# Altium schematic sheet 06_RK3588MQ.SchDoc (part 3 of 3)
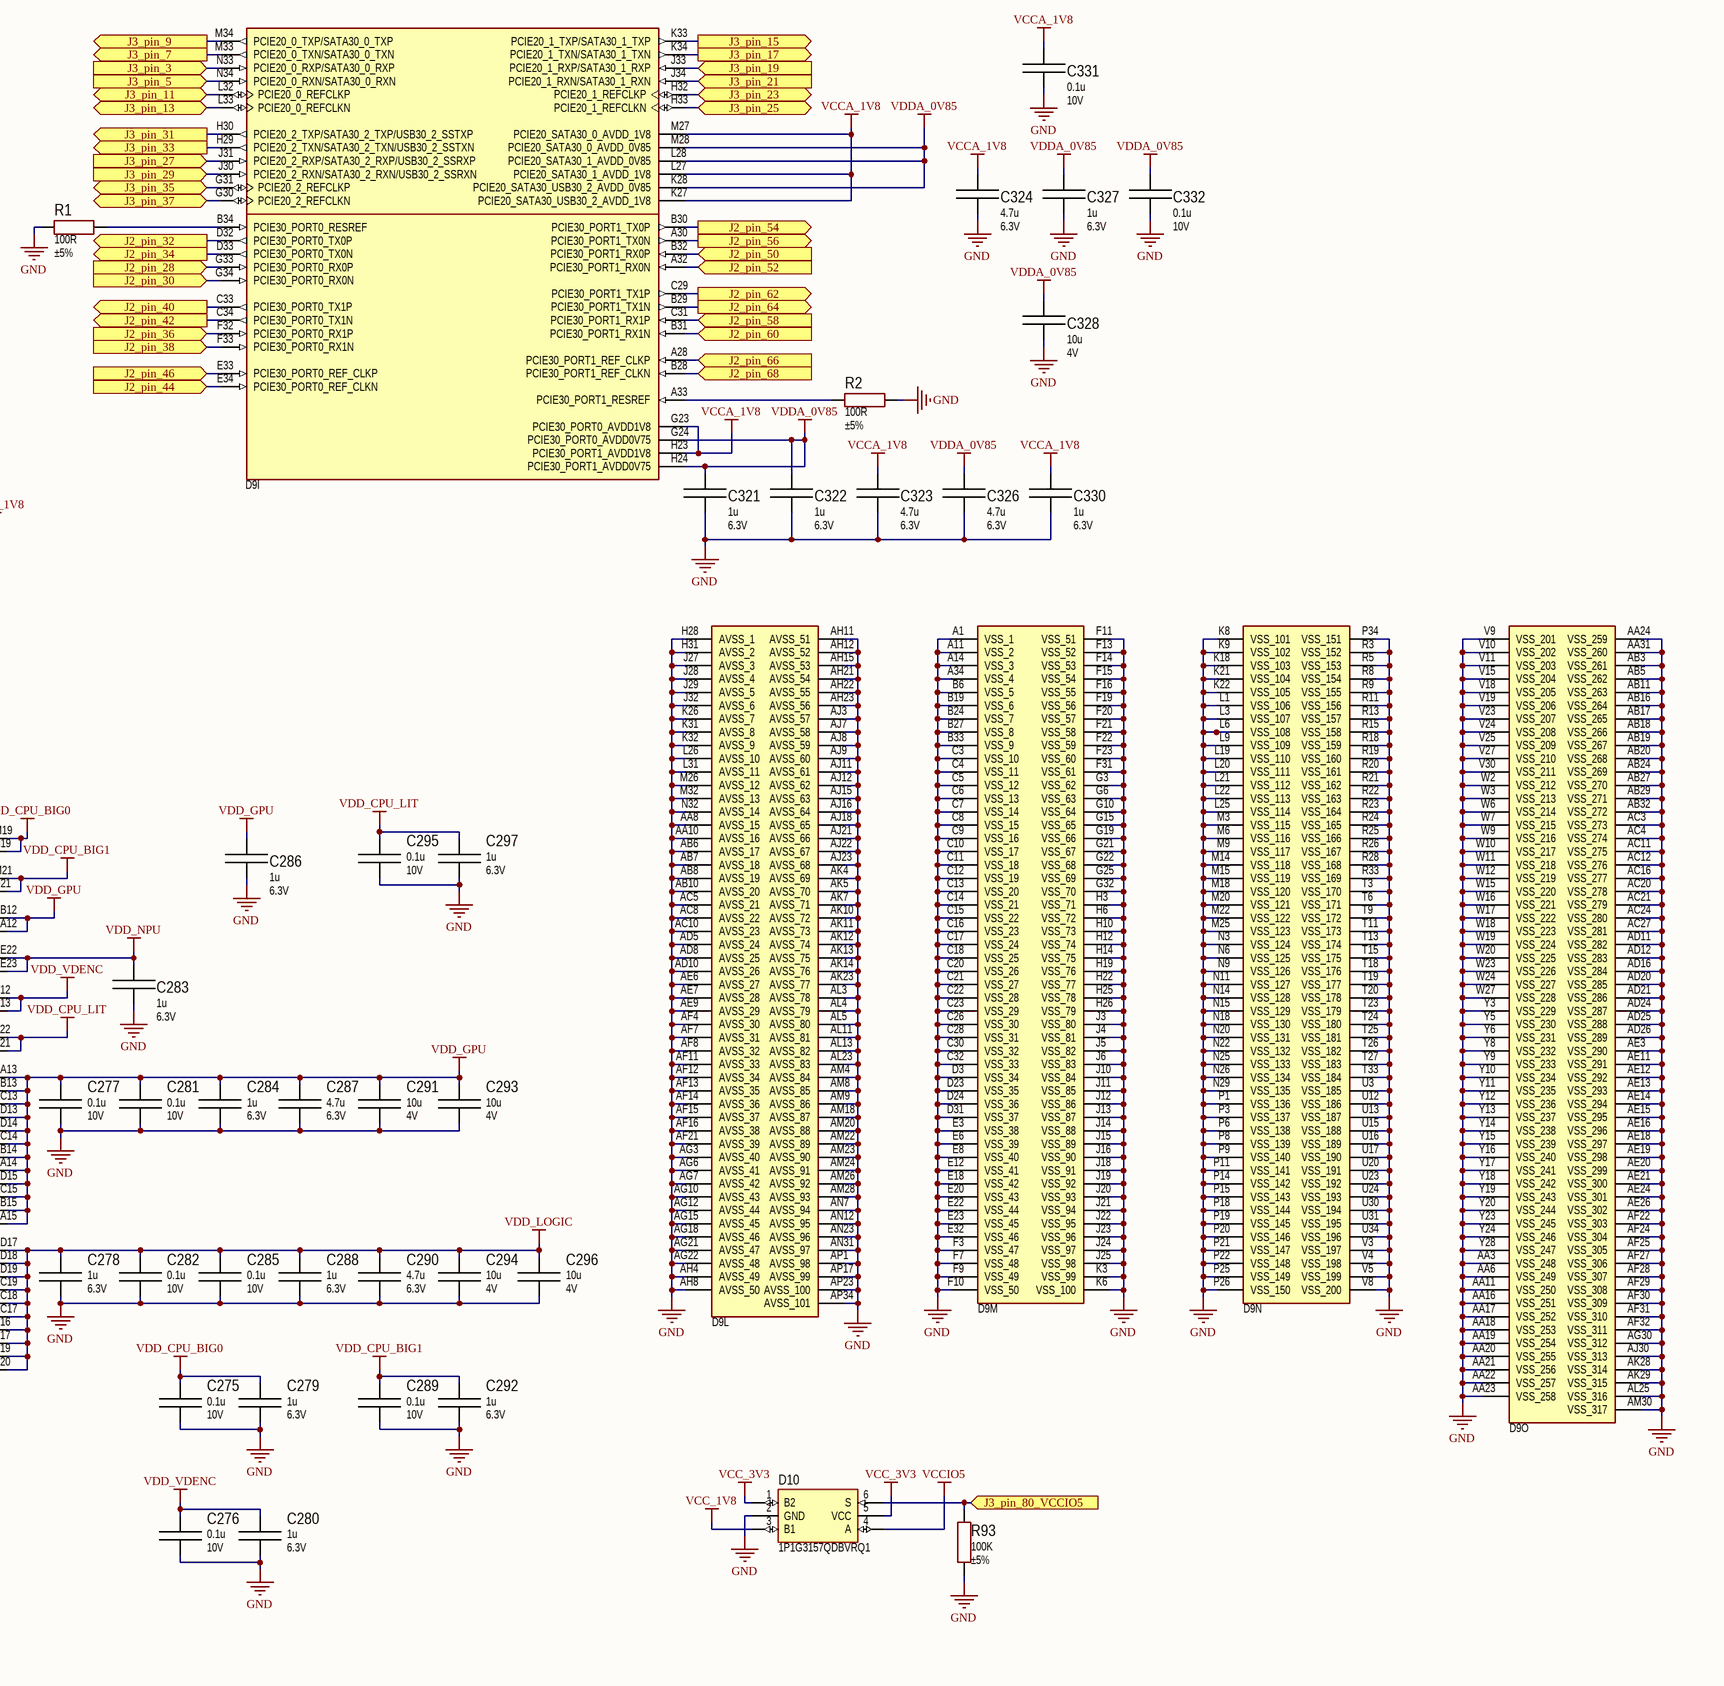
[diagram p7: 06_RK3588MQ.SchDoc, bottom right]

## Library data of the parts
C193 C197 = C1005C0G1H180J050BA: Ceramic capacitor, 18pF, C0G, ±5%, 50V, 0402, -55...+125°C; Manufacturer: TDK; Type: Ceramic SMD; PartNumber: C1005C0G1H180J050BA; Dielectric: C0G; Tolerance: ±5%; Temperature: -55...+125°C; Package: 0402; ComponentLink1Description: Link; ComponentLink1URL: https://product.tdk.com/en/system/files/dam/doc/product/capacitor/ceramic/mlcc/catalog/mlcc_commercial_general_en.pdf; ComponentLink2Description: LocalLink; ComponentLink2URL: C:\Users\Public\Documents\Altium\datasheet\Capacitors\mlcc_commercial_general_en.pdf
C194 C196 C200 C204 C207 C209-C211 C215 C217 C228 C233 C236 C240 C247 C257-C259 C261-C263 C265 C266 C278-C280 C283 C284 C286 C288 C292 C297 C304 C310 C313 C317 C319 C321 C322 C327 C330 = C0603X5R0J105M030BC: Ceramic capacitor, 1uF, X5R, ±20%, 6.3V, 0201, -55...+85°C; Manufacturer: TDK; Type: Ceramic SMD; PartNumber: C0603X5R0J105M030BC; Dielectric: X5R; Tolerance: ±20%; Temperature: -55...+85°C; Package: 0201; ComponentLink1Description: Link; ComponentLink1URL: https://product.tdk.com/system/files/dam/doc/product/capacitor/ceramic/mlcc/catalog/mlcc_commercial_general_en.pdf; ComponentLink2Description: LocalLink; ComponentLink2URL: C:\Users\Public\Documents\Altium\datasheet\Capacitors\mlcc_commercial_general_en.pdf
C195 C198 C199 C201-C203 C212 C214 C219 C220 C223 C241 C246 C253 C254 C260 C267-C272 C274-C277 C281 C282 C285 C289 C295 C303 C305-C309 C311 C314 C316 C325 C329 C331-C352 = C0603X5R1A104K030BC: Ceramic capacitor, 0.1uF, X5R, ±10%, 10V, 0201, -55...+85°C; Manufacturer: TDK; Type: Ceramic SMD; PartNumber: C0603X5R1A104K030BC; Dielectric: X5R; Tolerance: ±10%; Temperature: -55...+85°C; Package: 0201; ComponentLink1Description: Link; ComponentLink1URL: https://product.tdk.com/system/files/dam/doc/product/capacitor/ceramic/mlcc/catalog/mlcc_commercial_general_en.pdf; ComponentLink2Description: LocalLink; ComponentLink2URL: C:\Users\Public\Documents\Altium\datasheet\Capacitors\mlcc_commercial_general_en.pdf
C205 C206 C227 C230 C243-C245 C249 C252 C255 C256 C291 C293 C294 C296 C328 = CC0402MRX5R4BB106: Ceramic capacitor, 10uF, X5R, ±20%, 4V, 0402, -55...+85°C; Manufacturer: Yageo; Type: Ceramic SMD; Tolerance: ±5%; PartNumber: CC0402MRX5R4BB106; Dielectric: X5R; Temperature: -55...+85°C; Package: 0402; ComponentLink1Description: Link; ComponentLink1URL: https://www.yageo.com/upload/media/product/productsearch/datasheet/mlcc/UPY-GPHC_X5R_4V-to-50V_30.pdf; ComponentLink2Description: LocalLink; ComponentLink2URL: C:\Users\Public\Documents\Altium\datasheet\Capacitors\UPY-GPHC_X5R_4V-to-50V_30.pdf
C208 C234 C250 C251 C264 C287 C290 C312 C318 C320 C323 C324 C326 = C1005X5R0J475K050BC: Ceramic capacitor, 4,7uF, X5R, ±10%, 6.3V, 0402, -55...+85°C; Manufacturer: TDK; Type: Ceramic SMD; PartNumber: C1005X5R0J475K050BC; Dielectric: X5R; Tolerance: ±10%; Temperature: -55...+85°C; Package: 0402; ComponentLink1Description: Link; ComponentLink1URL: https://product.tdk.com/en/system/files/dam/doc/product/capacitor/ceramic/mlcc/catalog/mlcc_commercial_general_en.pdf; ComponentLink2Description: LocalLink; ComponentLink2URL: C:\Users\Public\Documents\Altium\datasheet\Capacitors\mlcc_commercial_general_en.pdf
C225 C232 C235 C248 = C1608X5R0J226M080AC: Ceramic capacitor, 22uF, X5R, ±20%, 6.3V, 0603, -55...+85°C; Manufacturer: TDK; Type: Ceramic SMD; PartNumber: C1608X5R0J226M080AC; Dielectric: X5R; Tolerance: ±20%; Temperature: -55...+85°C; Package: 0603; ComponentLink1Description: Link; ComponentLink1URL: https://product.tdk.com/system/files/dam/doc/product/capacitor/ceramic/mlcc/catalog/mlcc_commercial_general_en.pdf; ComponentLink2Description: LocalLink; ComponentLink2URL: C:\Users\Public\Documents\Altium\datasheet\Capacitors\mlcc_commercial_general_en.pdf
C273 = C1608X5R0J106K080AB: Ceramic capacitor, 10uF, X5R, ±10%, 6.3V, 0603, -55...+85°C; Manufacturer: TDK; Type: Ceramic SMD; PartNumber: C1608X5R0J106K080AB; Dielectric: X5R; Tolerance: ±10%; Temperature: -55...+85°C; Package: 0603; ComponentLink1Description: Link; ComponentLink1URL: https://product.tdk.com/system/files/dam/doc/product/capacitor/ceramic/mlcc/catalog/mlcc_commercial_general_en.pdf; ComponentLink2Description: LocalLink; ComponentLink2URL: C:\Users\Public\Documents\Altium\datasheet\Capacitors\mlcc_commercial_general_en.pdf
D9 = RK3588M: A high perfomance, low power AIoT processor; Manufacturer: Rockchip; PartNumber: RK3588M; Type: Processor; Package: FCBGA1088L; ComponentLink1Description: New link; ComponentLink1URL: C:\Users\Public\Documents\Altium\Datasheet\ICs\Rockchip_RK3588_Datasheet_V1.3-20220328.pdf; Temperature: -40...+125°C
D10 = 1P1G3157QDBVRQ1: Automotive Single-Pole Double-Throw Analog Switch; Manufacturer: Texas Instruments; ComponentLink1Description: Link; ComponentLink1URL: https://www.ti.com/lit/ds/symlink/sn74lvc1g3157-q1.pdf?ts=1743508565257&ref_url=https%253A%252F%252Fwww.ti.com%252Fproduct%252FSN74LVC1G3157-Q1; ComponentLink2Description: LocalLink; ComponentLink2URL: C:\Users\Public\Documents\Altium\Datasheet\ICs\sn74lvc1g3157-q1.pdf; Type: Analog Switch; Temperature: -40...+125°C; Package: SOT-23 (6); PartNumber: 1P1G3157QDBVRQ1
R1 R2 = RC0402JR-07100RL: Resistor film, 100R, ±5%, 0402, 0.0625W, -55...+155°C; Manufacturer: Yageo; PartNumber: RC0402JR-07100RL; Type: Resistor film; Power: 0.0625W; ComponentLink1Description: Link; ComponentLink1URL: https://www.yageo.com/upload/media/product/productsearch/datasheet/rchip/PYu-RC_Group_51_RoHS_L_12.pdf; Temperature: -55...+155°C; Package: 0402; ComponentLink2Description: LocalLink; ComponentLink2URL: C:\Users\Public\Documents\Altium\Datasheet\Resistors\PYu-RC_Group_51_RoHS_L_12.pdf
R73 R76 R81 R82 = RC0201FR-07240RL: Resistor film, 240R, ±1%, 0201, 0.05W, -55...+125°C; Manufacturer: Yageo; PartNumber: RC0201FR-07240RL; Type: Resistor film; Power: 0.05W; ComponentLink1Description: Link; ComponentLink1URL: https://www.yageo.com/upload/media/product/productsearch/datasheet/rchip/PYu-RC_Group_51_RoHS_L_12.pdf; Temperature: -55...+125°C; Package: 0201; ComponentLink2Description: LocalLink; ComponentLink2URL: C:\Users\Public\Documents\Altium\Datasheet\Resistors\PYu-RC_Group_51_RoHS_L_12.pdf
R74 R77 R87 R91 = RC0402JR-0722RL: Resistor film, 22R, ±5%, 0402, 0.0625W, -55...+155°C; Manufacturer: Yageo; PartNumber: RC0402JR-0722RL; Type: Resistor film; Power: 0.0625W; ComponentLink1Description: Link; ComponentLink1URL: https://www.yageo.com/upload/media/product/productsearch/datasheet/rchip/PYu-RC_Group_51_RoHS_L_12.pdf; Temperature: -55...+155°C; Package: 0402; ComponentLink2Description: LocalLink; ComponentLink2URL: C:\Users\Public\Documents\Altium\Datasheet\Resistors\PYu-RC_Group_51_RoHS_L_12.pdf
R75 = RC0402JR-07510KL: Resistor film, 510K, ±5%, 0402, 0.0625W, -55...+155°C; Manufacturer: Yageo; PartNumber: RC0402JR-07510KL; Type: Resistor film; Power: 0.0625W; ComponentLink1Description: Link; ComponentLink1URL: https://www.yageo.com/upload/media/product/productsearch/datasheet/rchip/PYu-RC_Group_51_RoHS_L_12.pdf; Temperature: -55...+155°C; Package: 0402; ComponentLink2Description: LocalLink; ComponentLink2URL: C:\Users\Public\Documents\Altium\Datasheet\Resistors\PYu-RC_Group_51_RoHS_L_12.pdf
R78 R85 R93 = RC0402JR-07100KL: Resistor film, 100K, ±5%, 0402, 0.0625W, -55...+155°C; Manufacturer: Yageo; PartNumber: RC0402JR-07100KL; Type: Resistor film; Power: 0.0625W; ComponentLink1Description: Link; ComponentLink1URL: https://www.yageo.com/upload/media/product/productsearch/datasheet/rchip/PYu-RC_Group_51_RoHS_L_12.pdf; Temperature: -55...+155°C; Package: 0402; ComponentLink2Description: LocalLink; ComponentLink2URL: C:\Users\Public\Documents\Altium\Datasheet\Resistors\PYu-RC_Group_51_RoHS_L_12.pdf
R79 R94-R97 = NC0402: NC, No BOM; PartNumber: NC; Type: Resistor film; Package: 0402
R80 R86 = RC0402JR-07120KL: Resistor film, 120K, ±5%, 0402, 0.0625W, -55...+155°C; Manufacturer: Yageo; PartNumber: RC0402JR-07120KL; Type: Resistor film; Power: 0.0625W; ComponentLink1Description: Link; ComponentLink1URL: https://www.yageo.com/upload/media/product/productsearch/datasheet/rchip/PYu-RC_Group_51_RoHS_L_12.pdf; Temperature: -55...+155°C; Package: 0402; ComponentLink2Description: LocalLink; ComponentLink2URL: C:\Users\Public\Documents\Altium\Datasheet\Resistors\PYu-RC_Group_51_RoHS_L_12.pdf
R83 R84 = RC0201JR-072K2L: Resistor film, 2K2, ±5%, 0201, 0.05W, -55...+125°C; Manufacturer: Yageo; PartNumber: RC0201JR-072K2L; Type: Resistor film; Power: 0.05W; ComponentLink1Description: Link; ComponentLink1URL: https://www.yageo.com/upload/media/product/productsearch/datasheet/rchip/PYu-RC_Group_51_RoHS_L_12.pdf; Temperature: -55...+125°C; Package: 0201; ComponentLink2Description: LocalLink; ComponentLink2URL: C:\Users\Public\Documents\Altium\Datasheet\Resistors\PYu-RC_Group_51_RoHS_L_12.pdf
R88 R89 = RC0603JR-070RL: Resistor film, 0R, 0603, 0.1W, -55...+155°C; Manufacturer: Yageo; PartNumber: RC0603JR-070RL; Type: Resistor film; Power: 0.1W; ComponentLink1Description: Link; ComponentLink1URL: https://www.yageo.com/upload/media/product/productsearch/datasheet/rchip/PYu-RC_Group_51_RoHS_L_12.pdf; Temperature: -55...+155°C; Package: 0603; ComponentLink2Description: LocalLink; ComponentLink2URL: C:\Users\Public\Documents\Altium\Datasheet\Resistors\PYu-RC_Group_51_RoHS_L_12.pdf
R90 R92 = RC0201JR-070RL: Resistor film, 0R, 0201, 0.05W, -55...+155°C; Manufacturer: Yageo; PartNumber: RC0201JR-070RL; Type: Resistor film; Power: 0.05W; ComponentLink1Description: Link; ComponentLink1URL: https://www.yageo.com/upload/media/product/productsearch/datasheet/rchip/PYu-RC_Group_51_RoHS_L_12.pdf; Temperature: -55...+155°C; Package: 0201; ComponentLink2Description: LocalLink; ComponentLink2URL: C:\Users\Public\Documents\Altium\Datasheet\Resistors\PYu-RC_Group_51_RoHS_L_12.pdf
ZQ1 = E3SB24.0000F08E11: Surface Mount Crystal Oscillator, 24MHz; Manufacturer: Hosonic; ComponentLink1Description: Link; ComponentLink1URL: https://hosonic.com/Upload/202409/product_2024092818084106.pdf; ComponentLink2Description: LocalLink; ComponentLink2URL: C:\Users\Public\Documents\Altium\Datasheet\ICs\product_2024092818084106.pdf; Type: Crystal Oscillators; Temperature: -40...+85°C; Package: 3.2 x 2.5 x 0.7mm ceramic package; PartNumber: E3SB24.0000F08E11; Value: 24MHz